# Altium schematic sheet DebugBoardLimiters.SchDoc
size 420 x 297 mm; SheetNumber: 6; SheetTotal: 6
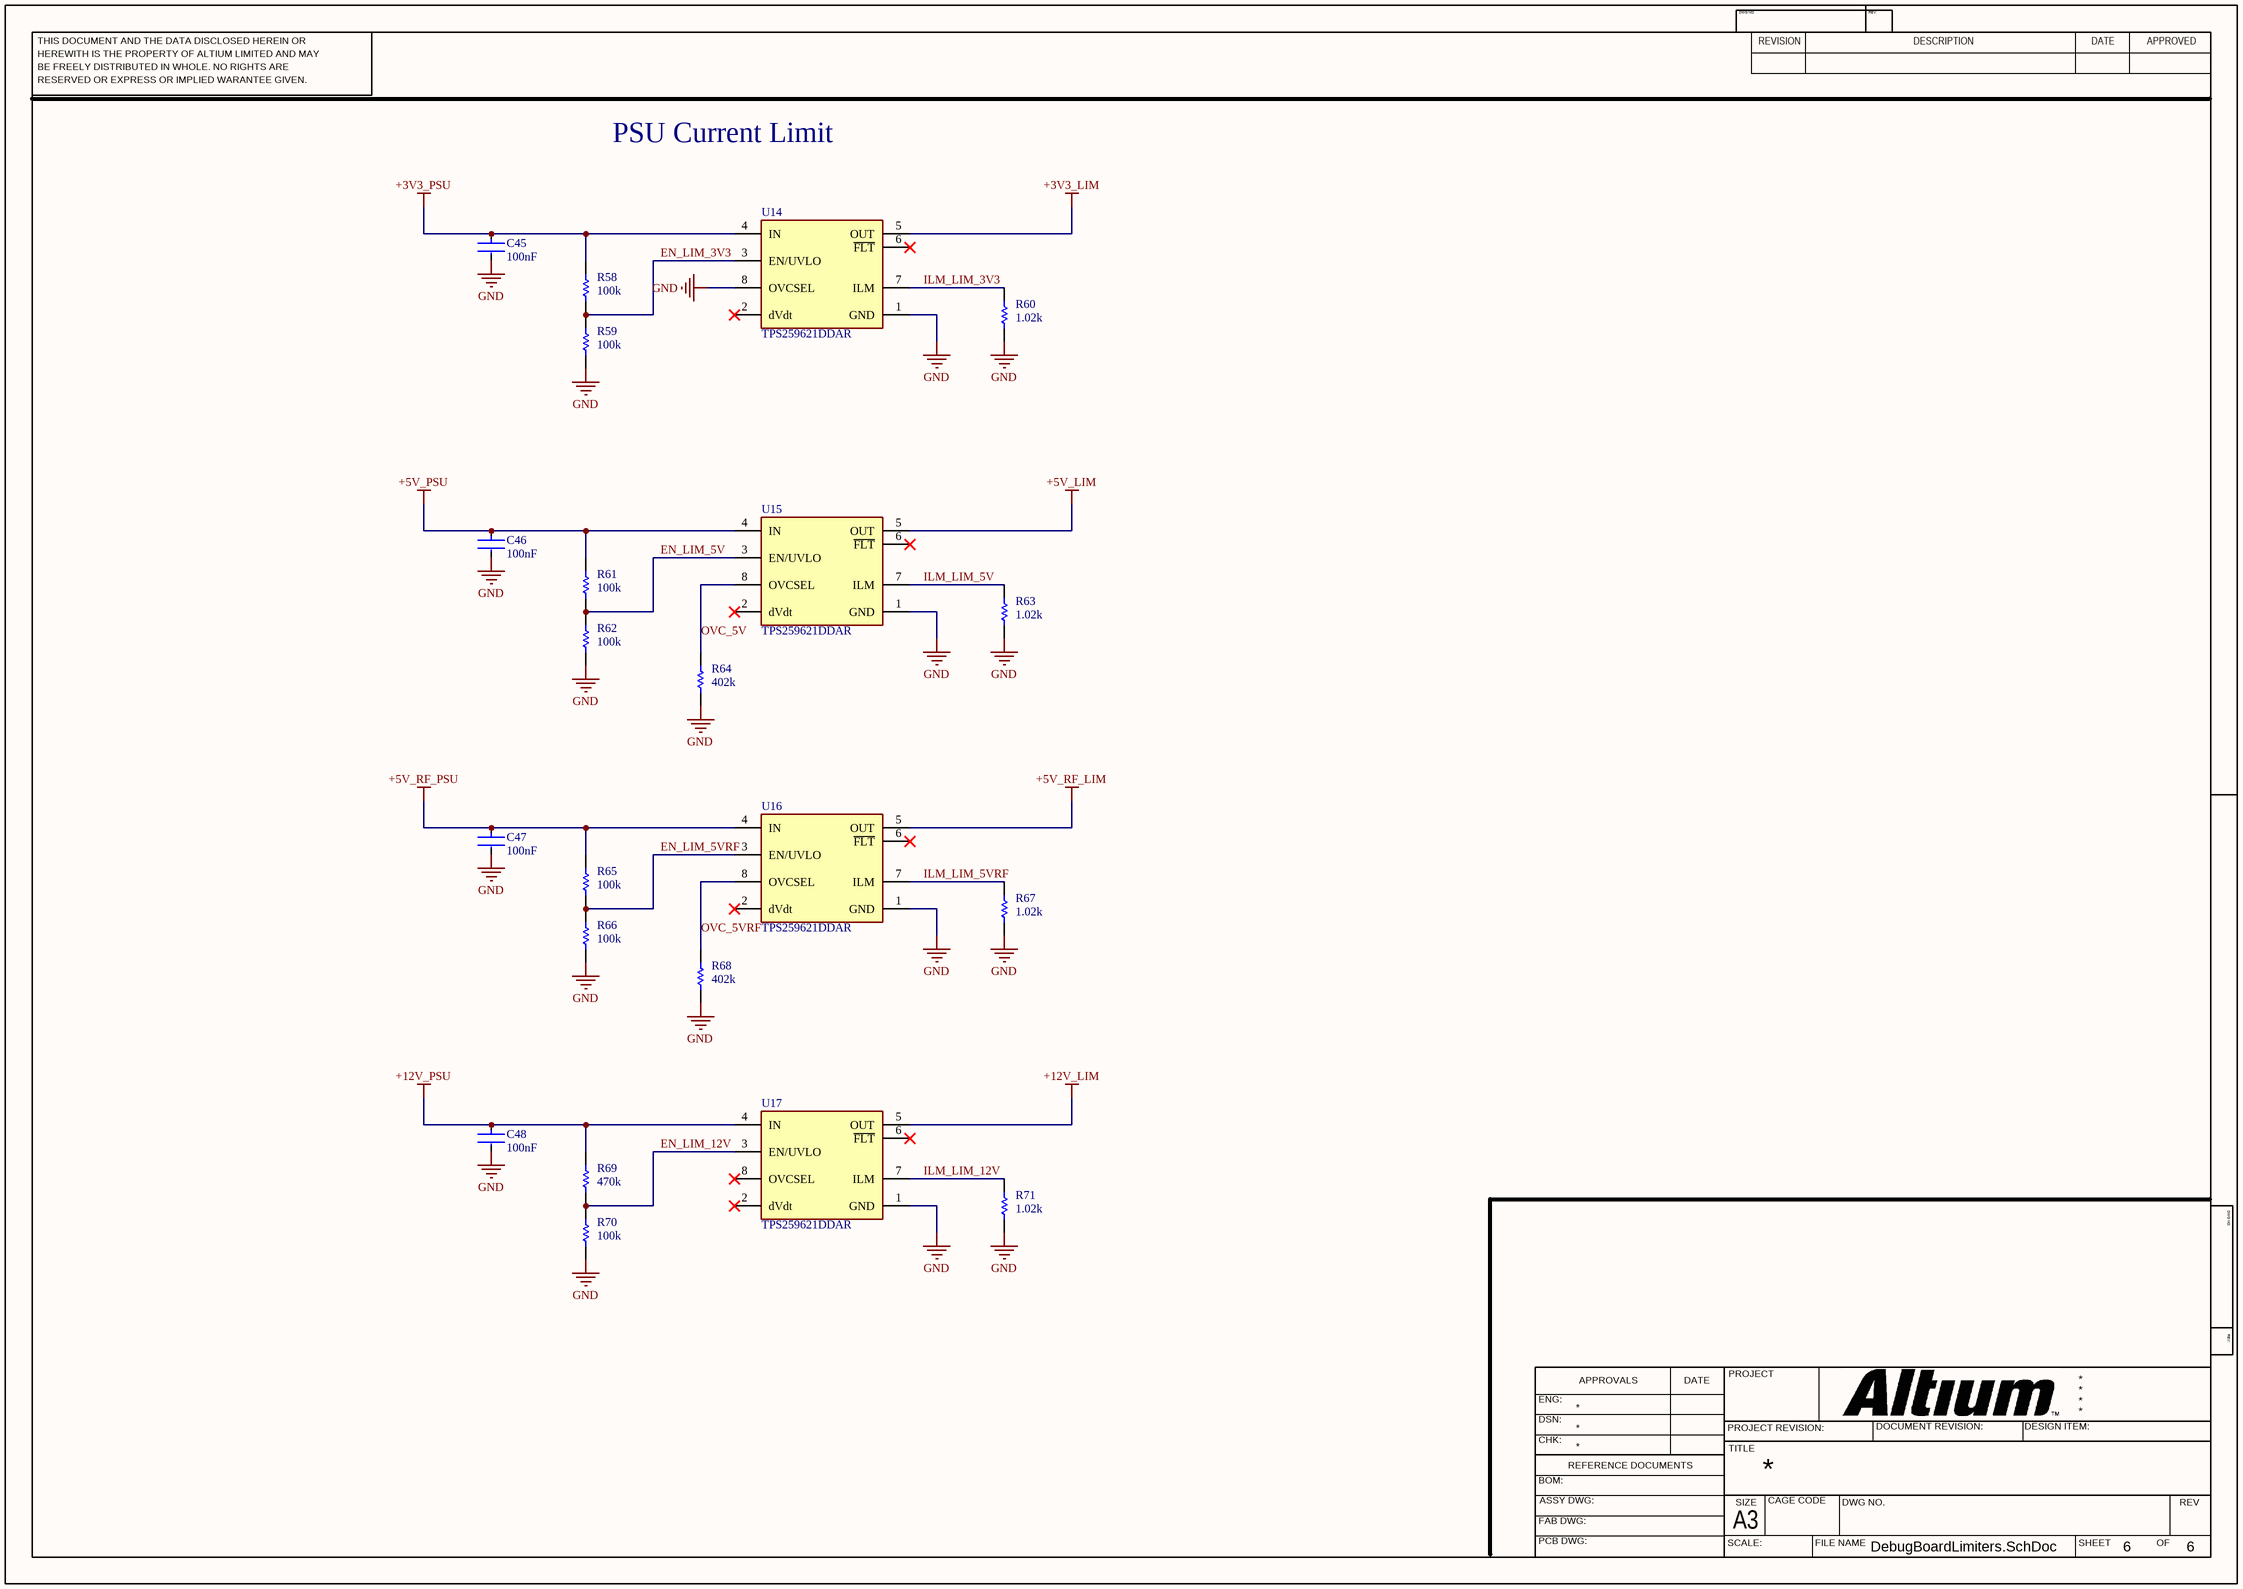
[diagram p0: DebugBoardLimiters.SchDoc]

## Parts
C45  100nF  [FP-C0805C-DN-MFG]
C46  100nF  [FP-C0805C-DN-MFG]
C47  100nF  [FP-C0805C-DN-MFG]
C48  100nF  [FP-C0805C-DN-MFG]
R58  100k  [RES_0805]
R59  100k  [RES_0805]
R60  1.02k  [RES_0805]
R61  100k  [RES_0805]
R62  100k  [RES_0805]
R63  1.02k  [RES_0805]
R64  402k  [RES_0805]
R65  100k  [RES_0805]
R66  100k  [RES_0805]
R67  1.02k  [RES_0805]
R68  402k  [RES_0805]
R69  470k  [RES_0805]
R70  100k  [RES_0805]
R71  1.02k  [RES_0805]
U14  TPS259621DDAR  [SOIC127P600X170-9N]
U15  TPS259621DDAR  [SOIC127P600X170-9N]
U16  TPS259621DDAR  [SOIC127P600X170-9N]
U17  TPS259621DDAR  [SOIC127P600X170-9N]

## Nets
+3V3_LIM: U14.5(OUT)
+3V3_PSU: C45.1 R58.1 U14.4(IN)
+5V_LIM: U15.5(OUT)
+5V_PSU: C46.1 R61.1 U15.4(IN)
+5V_RF_LIM: U16.5(OUT)
+5V_RF_PSU: C47.1 R65.1 U16.4(IN)
+12V_LIM: U17.5(OUT)
+12V_PSU: C48.1 R69.1 U17.4(IN)
GND: C45.2 C46.2 C47.2 C48.2 R59.2 R60.2 R62.2 R63.2 R64.2 R66.2 R67.2 R68.2 R70.2 R71.2 U14.1(GND) U14.8(OVCSEL) U15.1(GND) U16.1(GND) U17.1(GND)
EN_LIM_3V3: R58.2 R59.1 U14.3(EN/UVLO)
EN_LIM_5V: R61.2 R62.1 U15.3(EN/UVLO)
EN_LIM_5VRF: R65.2 R66.1 U16.3(EN/UVLO)
EN_LIM_12V: R69.2 R70.1 U17.3(EN/UVLO)
ILM_LIM_3V3: R60.1 U14.7(ILM)
ILM_LIM_5V: R63.1 U15.7(ILM)
ILM_LIM_5VRF: R67.1 U16.7(ILM)
ILM_LIM_12V: R71.1 U17.7(ILM)
OVC_5V: R64.1 U15.8(OVCSEL)
OVC_5VRF: R68.1 U16.8(OVCSEL)

Not connected (* = marked no-connect by the designer): U14 2(dVdt)* 6(~{FLT})*; U15 2(dVdt)* 6(~{FLT})*; U16 2(dVdt)* 6(~{FLT})*; U17 2(dVdt)* 6(~{FLT})* 8(OVCSEL)*

## Notes on the sheet
- PSU Current Limit
- THIS DOCUMENT AND THE DATA DISCLOSED HEREIN OR
- HEREWITH IS THE PROPERTY OF ALTIUM LIMITED AND MAY
- DWG NO:
- REVISION
- REV:
- DESCRIPTION
- DATE
- APPROVED
- BE FREELY DISTRIBUTED IN WHOLE. NO RIGHTS ARE
- RESERVED OR EXPRESS OR IMPLIED WARANTEE GIVEN.
- ENG:
- APPROVALS
- PROJECT
- DSN:
- CHK:
- REFERENCE DOCUMENTS
- PROJECT REVISION:
- TITLE
- DOCUMENT REVISION:
- DESIGN ITEM:
- BOM:
- FAB DWG:
- PCB DWG:
- ASSY DWG:
- SCALE:
- A3
- SIZE
- CAGE CODE
- FILE NAME
- DWG NO.
- SHEET
- OF
- REV

## Library data of the parts
C45-C48 = CMP-03020-000950-1: CAP CER 0.1UF 50V X7R 0805; Manufacturer: KEMET; Manufacturer Part Number: C0805C104J5RACTU; Temperature Coefficient: 30ppm/°C; Value: 0.10 μF; Material: Ceramic; Tolerance: 0.05; Voltage Rating: 50 V; Digikey Description: CAP CER 0.1UF 50V X7R 0805; Octopart: https://octopart.com/c0805c104j5ractu-kemet-104634; RoHS: TRUE; Device Class L1: Passive Components; Temperature Characteristic: X7R; Device Class L3: Ceramic Capacitors; Lead Free: Yes; Automotive: No; Category: Cap; Temperature: -55°C to +125°C; Package: C0805C-DN; Temperature Range High: +125°C; Height: 0.88mm; Capacitance: 0.10 μF; Temperature Range Low: -55°C; ComponentLink2Description: Datasheet; ComponentLink2URL: https://content.kemet.com/datasheets/KEM_C1003_C0G_SMD.pdf; Ipc Land Pattern Name: CAPC200125X78; Device Class L2: Capacitors; Mouser Description: Multilayer Ceramic Capacitors MLCC - SMD/SMT 50volts 0.1uF X7R 5%
R58-R71 = CMP-009-00183-1: Resistor SMD 0805 - Generic; Source: Generic_Schematic_Library.SchLib; Design Item ID: RES_0805
U14-U17 = TPS259621DDAR: eFuse, 2.7-19 V, 0.125-2 A adjustable current limit, 89 mOhm, OV clamp, auto-retry, HSOIC-8; Manufacturer: Texas Instruments; Current Rating: 2A; Max Supply Voltage: 19V; On-State Resistance: 120mΩ; Value: 120mΩ; Min Supply Voltage: 2.7V; Case/Package: HSOIC-8 (DDA); Datasheet: https://www.ti.com/lit/ds/symlink/tps2596.pdf; Pins: 8; Height: 1.7mm; Manufacturer Part Number: TPS259621DDAR